# Altium schematic sheet Sheet1.SchDoc
size A4; SheetNumber: 1; SheetTotal: 2
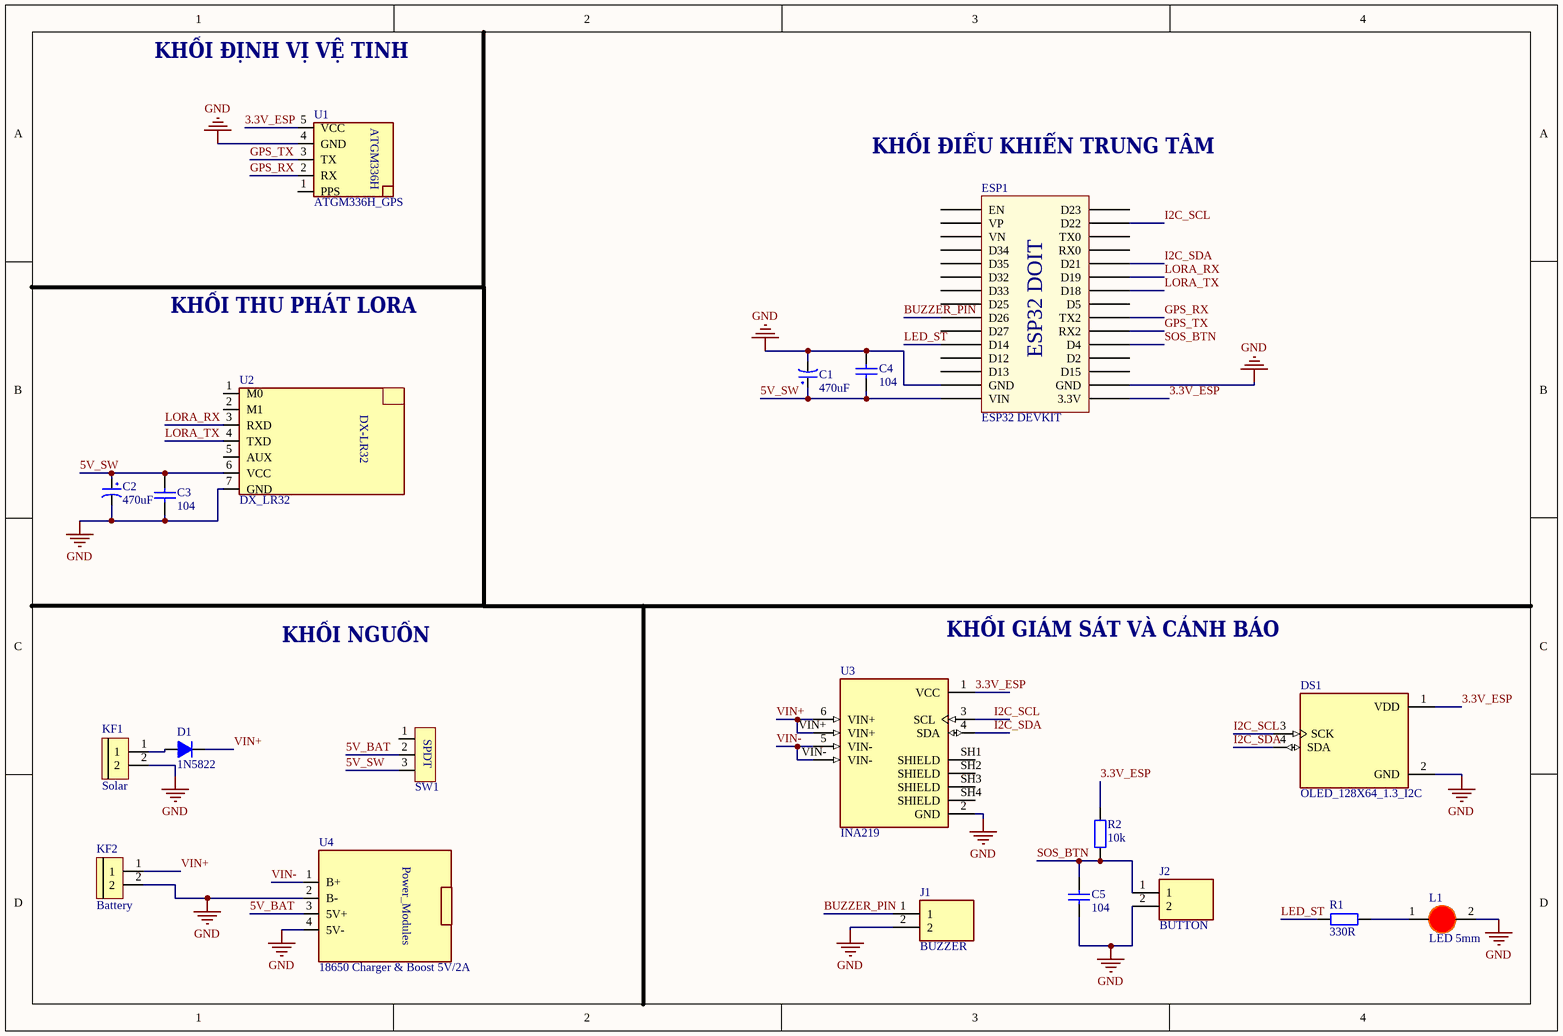
[diagram p0: Sheet1.SchDoc]

## Parts
C1  470uF  [tu hoa 8mm]
C2  470uF  [tu hoa 8mm]
C3  104  [tu gom]
C4  104  [tu gom]
C5  104  [tu gom]
D1  1N5822  [DIODE 1A]
DS1  OLED_128X64_1.3_I2C  [LCD_OLED_128X64_1.3_I2C]
ESP1  ESP32 DEVKIT  [ESP32 WROOM 32 KIT]
J1  BUZZER  [TE_3-644456-2]
J2  BUTTON  [TE_3-644456-2]
KF1  Solar  [Con 2 KF301 5.08]
KF2  Battery  [Con 2 KF301 5.08]
L1  LED 5mm  [LED-5MM-RED]
R1  330R  [tro vach 1/2w]
R2  10k  [tro vach 1/2w]
SW1  SS12F15  [SS12F15]  (value not drawn)
U1  ATGM336H_GPS  [ATGM336H]
U2  DX_LR32  [DX_LR32]
U3  INA219  [MODULE_INA219]
U4  18650 Charger & Boost 5V/2A  [Power_Modules]

## Nets
GND: C1.2 C2.2 C3.2 C4.1 C5.2 DS1.2(GND) ESP1.14(GND) ESP1.17(GND) J1.2 J2.2 KF1.2 KF2.2 L1.2(K) U1.4(GND) U2.7(GND) U3.2(GND) U4.2(B-) U4.4(5V-)
3.3V_ESP: DS1.1(VDD) ESP1.16(3.3V) R2.2 U1.5(VCC) U3.1(VCC)
5V_BAT: SW1.2(COM) U4.3(5V+)
5V_SW: C1.1 C2.1 C3.1 C4.2 ESP1.15(VIN) SW1.3 U2.6(VCC)
BUZZER_PIN: ESP1.9(D26) J1.1
GPS_RX: ESP1.22(TX2) U1.2(RX)
GPS_TX: ESP1.21(RX2) U1.3(TX)
I2C_SCL: DS1.3(SCK) ESP1.29(D22) U3.3(SCL)
I2C_SDA: DS1.4(SDA) ESP1.26(D21) U3.4(SDA)
LED_ST: ESP1.11(D14) R1.1
LORA_RX: ESP1.25(D19) U2.3(RXD)
LORA_TX: ESP1.24(D18) U2.4(TXD)
SOS_BTN: C5.1 ESP1.20(D4) J2.1 R2.1
VIN+: D1.2(K) KF2.1 U3.6(VIN+) U3.VIN+
VIN-: U3.5(VIN-) U3.VIN- U4.1(B+)
NetD1_1: D1.1(A) KF1.1
NetL1_1: L1.1(A) R1.2

Not connected (* = marked no-connect by the designer): ESP1 1(EN) 2(VP) 3(VN) 4(D34) 5(D35) 6(D32) 7(D33) 8(D25) 10(D27) 12(D12) 13(D13) 18(D15) 19(D2) 23(D5) 27(RX0) 28(TX0) 30(D23); SW1 1; U1 1(PPS); U2 1(M0) 2(M1) 5(AUX); U3 SH1(SHIELD) SH2(SHIELD) SH3(SHIELD) SH4(SHIELD)

## Notes on the sheet
- KHỐI ĐỊNH VỊ VỆ TINH
- (near ESP1) KHỐI ĐIỀU KHIỂN TRUNG TÂM
- KHỐI THU PHÁT LORA
- KHỐI NGUỒN
- (near U3) KHỐI GIÁM SÁT VÀ CẢNH BÁO
- (in symbol ATGM336H_GPS) ATGM336H
- (in symbol DX_LR32) DX-LR32
- (in symbol ESP32 WROOM 32 KIT) ESP32 DOIT
- (in symbol SS12F15) SPDT

## Library data of the parts
C1 C2 = Tu Hoa 470uF 16V 8x11: Cắm; Don_Vi: Con; So_Chan: 2; Ten_Linh_Kien: Tụ Hóa 470uF 16V 8x11MM; Ma_Hang: MH006550; Chung_Loai: Cắm; Kieu_Chan: *
C3-C5 = Tu gom 104 50V: Cắm; So_Chan: 2; Ten_Linh_Kien: Tụ gốm 104 100nF 50V; Don_Vi: Con; Ma_Hang: MH004761; Chung_Loai: Cắm; Kieu_Chan: *
D1 = Diode 1N4007: Cắm; Ten_Linh_Kien: Diode 1N4007 1A (DIP); Don_Vi: Con; Ma_Hang: MH001063; Ghi Chu: *; Kieu_Chan: *; Chung_Loai: Cắm
DS1 = OLED_128X64_1.3_I2C: Non-Touch Graphic LCD Display Module Transmissive White OLED, Monochrome I2C 1.3 (33.02mm) 128 x 64; MF: UNIVERSAL-SOLDER Electronics Ltd; MP: OLED 128x64 1.3&quot; I2C; SnapEDA_Link: https://www.snapeda.com/parts/OLED%20128x64%201.3%22%20I2C/UNIVERSAL-SOLDER+Electronics+Ltd/view-part/?ref=snap; Package: None; Value: *; Check_prices: https://www.snapeda.com/parts/OLED%20128x64%201.3%22%20I2C/UNIVERSAL-SOLDER+Electronics+Ltd/view-part/?ref=eda
ESP1 = ESP32 WROOM 32 KIT
J1 J2 = 3-644456-2: HEADER ASSEMBLY, NARROW, MTA-100, 2 POSITION, STRAIGHT | TE Connectivity 3-644456-2; SnapEDA_Link: https://www.snapeda.com/parts/3-644456-2/TE+Connectivity+AMP+Connectors/view-part/?ref=snap; Package: None; Value: *; MF: TE Connectivity; MP: 3-644456-2; Check_prices: https://www.snapeda.com/parts/3-644456-2/TE+Connectivity+AMP+Connectors/view-part/?ref=eda
KF1 KF2 = CON 2 KF301: Cắm; Ma_Hang: MH000987; Ten_Linh_Kien: CON 2 KF301-2P 5.08MM Xanh Dương; Don_Vi: Con; Chung_Loai: Cắm; Ghi_Chu: *; Kieu_Chan: *
L1 = LED 5mm Do: Cắm; Don_Vi: Con; Ma_Hang: MH008967; Ten_Linh_Kien: Led 5MM Phủ Đỏ (1000c); Ghi_Chu: *; Kieu_Chan: *; Chung_Loai: Cắm
R1 = Tro Vach 1/2W 5% 0.22R: Cắm; So_Chan: 2; Ten_Linh_Kien: Trở 5% 1/2w 0.22R; Ma_Hang: MH006031; Don_Vi: Con; Chung_Loai: Cắm; Kieu_Chan: *
R2 = Tro Vach 1/2W 5% 10k: Cắm; Don_Vi: Con; So_Chan: 2; Ten_Linh_Kien: Trở 5% 1/2w 10k; Ma_Hang: MH006206; Chung_Loai: Cắm; Kieu_Chan: *
U3 = INA219: INA219 High Side DC Current Sensor Breakout - 26V Â±3.2A Max ¦ Adafruit Industries 904; MP: INA219 High Side DC Current Sensor Breakout - 26V Â±3.2A Max - STEMMA QT; SnapEDA_Link: https://www.snapeda.com/parts/INA219%20High%20Side%20DC%20Current%20Sensor%20Breakout%20-%2026V%20%C2%B13.2A%20Max%20-%20STEMMA%20QT/Adafruit+Industries/view-part/?ref=snap; Package: NON-STANDARD-8 ADAFRUIT; Value: *; MF: Adafruit Industries; Check_prices: https://www.snapeda.com/parts/INA219%20High%20Side%20DC%20Current%20Sensor%20Breakout%20-%2026V%20%C2%B13.2A%20Max%20-%20STEMMA%20QT/Adafruit+Industries/view-part/?ref=eda
U4 = Power_Modules: MODULE_18650_CHARGER_BOOST